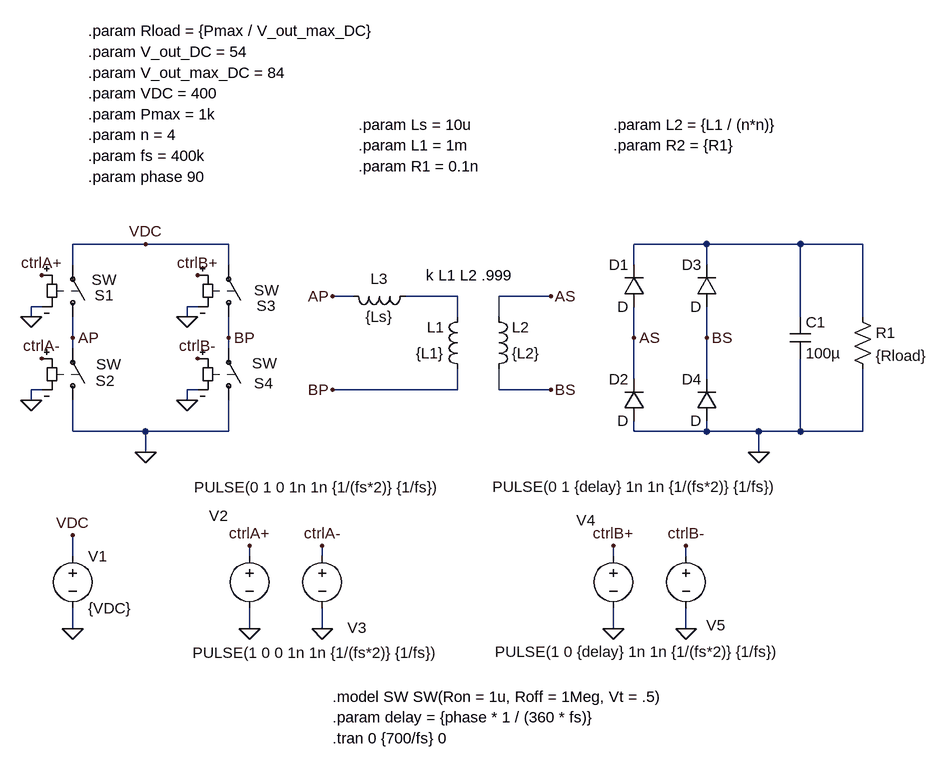
[diagram p0: schematic PSFB_Operation.asc]
PSFB_Operation.asc, the LTspice schematic file:
Version 4.1
SHEET 1 1956 952
WIRE 560 -80 448 -80
WIRE 688 -80 560 -80
WIRE 1424 -80 1312 -80
WIRE 1568 -80 1424 -80
WIRE 1664 -80 1568 -80
WIRE 448 -48 448 -80
WIRE 688 -48 688 -80
WIRE 1312 -48 1312 -80
WIRE 1424 -48 1424 -80
WIRE 880 0 848 0
WIRE 1040 0 960 0
WIRE 1184 0 1104 0
WIRE 400 16 384 16
WIRE 640 16 624 16
WIRE 384 32 384 16
WIRE 624 32 624 16
WIRE 1040 32 1040 0
WIRE 1104 32 1104 0
WIRE 1568 32 1568 -80
WIRE 1664 32 1664 -80
WIRE 448 64 448 32
WIRE 688 64 688 32
WIRE 1312 64 1312 16
WIRE 1424 64 1424 16
WIRE 448 80 448 64
WIRE 688 80 688 64
WIRE 1312 128 1312 64
WIRE 1424 128 1424 64
WIRE 400 144 384 144
WIRE 640 144 624 144
WIRE 1040 144 1040 112
WIRE 1040 144 848 144
WIRE 1104 144 1104 112
WIRE 1184 144 1104 144
WIRE 384 160 384 144
WIRE 624 160 624 144
WIRE 448 208 448 160
WIRE 560 208 448 208
WIRE 688 208 688 160
WIRE 688 208 560 208
WIRE 1312 208 1312 192
WIRE 1424 208 1424 192
WIRE 1424 208 1312 208
WIRE 1504 208 1424 208
WIRE 1568 208 1568 96
WIRE 1568 208 1504 208
WIRE 1664 208 1664 112
WIRE 1664 208 1568 208
WIRE 560 240 560 208
WIRE 1504 240 1504 208
WIRE 448 400 448 368
WIRE 720 400 720 384
WIRE 832 400 832 384
WIRE 1280 400 1280 384
WIRE 1392 400 1392 384
WIRE 448 512 448 480
WIRE 720 512 720 480
WIRE 832 512 832 480
WIRE 1280 512 1280 480
WIRE 1392 512 1392 480
FLAG 448 512 0
FLAG 448 368 VDC
FLAG 384 32 0
FLAG 400 -32 ctrlA+
FLAG 384 160 0
FLAG 400 96 ctrlA-
FLAG 448 64 AP
FLAG 624 32 0
FLAG 640 -32 ctrlB+
FLAG 624 160 0
FLAG 640 96 ctrlB-
FLAG 688 64 BP
FLAG 560 -80 VDC
FLAG 560 240 0
FLAG 848 0 AP
FLAG 848 144 BP
FLAG 1184 0 AS
FLAG 1184 144 BS
FLAG 1312 64 AS
FLAG 1424 64 BS
FLAG 720 512 0
FLAG 720 384 ctrlA+
FLAG 832 512 0
FLAG 832 384 ctrlA-
FLAG 1280 512 0
FLAG 1280 384 ctrlB+
FLAG 1392 512 0
FLAG 1392 384 ctrlB-
FLAG 1504 240 0
SYMBOL voltage 448 384 R0
WINDOW 123 0 0 Left 0
WINDOW 39 0 0 Left 0
SYMATTR InstName V1
SYMATTR Value {VDC}
SYMBOL sw 448 48 M180
WINDOW 0 34 49 Left 2
WINDOW 3 29 73 Left 2
SYMATTR InstName S1
SYMBOL sw 448 176 M180
WINDOW 0 35 46 Left 2
WINDOW 3 36 71 Left 2
SYMATTR InstName S2
SYMBOL sw 688 48 M180
WINDOW 0 43 33 Left 2
WINDOW 3 39 57 Left 2
SYMATTR InstName S3
SYMBOL sw 688 176 M180
WINDOW 0 39 42 Left 2
WINDOW 3 36 73 Left 2
SYMATTR InstName S4
SYMBOL ind 1056 128 R180
WINDOW 3 36 40 Left 2
WINDOW 0 36 80 Left 2
SYMATTR Value {L1}
SYMATTR InstName L1
SYMATTR Type ind
SYMATTR SpiceLine Rser={R1}
SYMBOL diode 1328 16 R180
WINDOW 0 24 64 Left 2
WINDOW 3 24 0 Left 2
SYMATTR InstName D1
SYMBOL diode 1328 192 R180
WINDOW 0 24 64 Left 2
WINDOW 3 24 0 Left 2
SYMATTR InstName D2
SYMBOL diode 1440 16 R180
WINDOW 0 24 64 Left 2
WINDOW 3 24 0 Left 2
SYMATTR InstName D3
SYMBOL diode 1440 192 R180
WINDOW 0 24 64 Left 2
WINDOW 3 24 0 Left 2
SYMATTR InstName D4
SYMBOL res 1648 16 R0
SYMATTR InstName R1
SYMATTR Value {Rload}
SYMBOL cap 1552 32 R0
SYMATTR InstName C1
SYMATTR Value 100µ
SYMBOL ind 1088 128 M180
WINDOW 3 36 40 Left 2
WINDOW 0 36 80 Left 2
SYMATTR Value {L2}
SYMATTR InstName L2
SYMATTR Type ind
SYMATTR SpiceLine Rser={R2}
SYMBOL voltage 720 384 R0
WINDOW 0 -62 -46 Left 2
WINDOW 3 294 -90 Right 2
WINDOW 123 0 0 Left 0
WINDOW 39 0 0 Left 0
SYMATTR InstName V2
SYMATTR Value PULSE(0 1 0 1n 1n {1/(fs*2)} {1/fs})
SYMBOL voltage 832 384 R0
WINDOW 0 39 126 Left 2
WINDOW 3 180 165 Right 2
WINDOW 123 0 0 Left 0
WINDOW 39 0 0 Left 0
SYMATTR InstName V3
SYMATTR Value PULSE(1 0 0 1n 1n {1/(fs*2)} {1/fs})
SYMBOL voltage 1280 384 R0
WINDOW 0 -57 -39 Left 2
WINDOW 3 -186 -91 Left 2
WINDOW 123 0 0 Left 0
WINDOW 39 0 0 Left 0
SYMATTR InstName V4
SYMATTR Value PULSE(0 1 {delay} 1n 1n {1/(fs*2)} {1/fs})
SYMBOL voltage 1392 384 R0
WINDOW 0 31 122 Left 2
WINDOW 3 -294 163 Left 2
WINDOW 123 0 0 Left 0
WINDOW 39 0 0 Left 0
SYMATTR InstName V5
SYMATTR Value PULSE(1 0 {delay} 1n 1n {1/(fs*2)} {1/fs})
SYMBOL ind 976 -16 R90
WINDOW 0 5 56 VBottom 2
WINDOW 3 32 56 VTop 2
SYMATTR InstName L3
SYMATTR Value {Ls}
TEXT 848 616 Left 2 !.model SW SW(Ron = 1u, Roff = 1Meg, Vt = .5)
TEXT 992 -32 Left 2 !k L1 L2 .999
TEXT 472 -312 Left 2 !.param VDC = 400
TEXT 472 -280 Left 2 !.param Pmax = 1k
TEXT 472 -248 Left 2 !.param n = 4
TEXT 472 -216 Left 2 !.param fs = 400k
TEXT 848 680 Left 2 !.tran 0 {700/fs} 0
TEXT 472 -184 Left 2 !.param phase 90
TEXT 848 648 Left 2 !.param delay = {phase * 1 / (360 * fs)}
TEXT 888 -232 Left 2 !.param L1 = 1m
TEXT 1280 -264 Left 2 !.param L2 = {L1 / (n*n)}
TEXT 888 -200 Left 2 !.param R1 = 0.1n
TEXT 1280 -232 Left 2 !.param R2 = {R1}
TEXT 888 -264 Left 2 !.param Ls = 10u
TEXT 472 -376 Left 2 !.param V_out_DC = 54
TEXT 472 -408 Left 2 !.param Rload = {Pmax / V_out_max_DC}
TEXT 472 -344 Left 2 !.param V_out_max_DC = 84

The netlist it stands for:
* PSFB_Operation.asc
V1 VDC 0 {VDC}
S1 AP VDC ctrlA+ 0 SW
S2 0 AP ctrlA- 0 SW
S3 BP VDC ctrlB+ 0 SW
S4 0 BP ctrlB- 0 SW
L1 BP N002 {L1} Rser={R1}
D1 AS N001 D
D2 0 AS D
D3 BS N001 D
D4 0 BS D
R1 N001 0 {Rload}
C1 N001 0 100µ
L2 BS AS {L2} Rser={R2}
V2 ctrlA+ 0 PULSE(0 1 0 1n 1n {1/(fs*2)} {1/fs})
V3 ctrlA- 0 PULSE(1 0 0 1n 1n {1/(fs*2)} {1/fs})
V4 ctrlB+ 0 PULSE(0 1 {delay} 1n 1n {1/(fs*2)} {1/fs})
V5 ctrlB- 0 PULSE(1 0 {delay} 1n 1n {1/(fs*2)} {1/fs})
L3 N002 AP {Ls}
.model D D
.lib standard.dio
.model SW SW(Ron = 1u, Roff = 1Meg, Vt = .5)
k L1 L2 .999
.param VDC = 400
.param Pmax = 1k
.param n = 4
.param fs = 400k
.tran 0 {700/fs} 0
.param phase 90
.param delay = {phase * 1 / (360 * fs)}
.param L1 = 1m
.param L2 = {L1 / (n*n)}
.param R1 = 0.1n
.param R2 = {R1}
.param Ls = 10u
.param V_out_DC = 54
.param Rload = {Pmax / V_out_max_DC}
.param V_out_max_DC = 84
.backanno
.end

* Results of the author's LTspice run, read from the files saved beside the schematic
* Operating Point, zero values left out:
*   V(ctrla-) = 1 V
*   V(ctrlb-) = 1 V
*   V(vdc) = 400 V
*   I(V1) = -800 µA
*   I(S4) = 400 µA
*   I(S2) = 400 µA
*   I(S1) = 400 µA
*   I(S3) = 400 µA
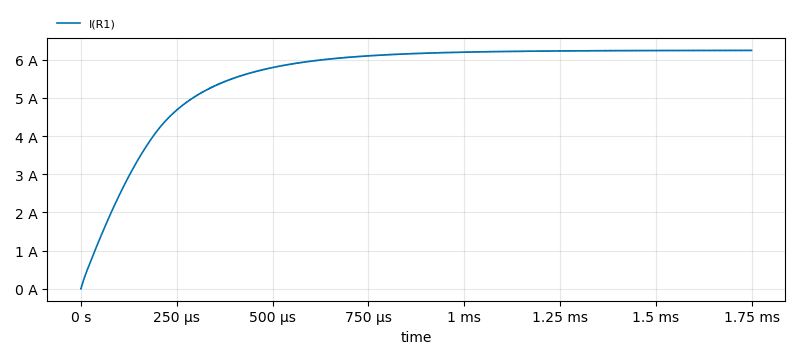
[diagram p1: Transient Analysis of PSFB_Operation.asc, plotted from the saved traces]
* Transient Analysis, 1 run:
*   I(R1): min 0 A, max 6.244 A, average 5.564 A, rms 5.713 A, last 6.242 A